# Altium schematic sheet logic_control.SchDoc
size 420 x 297 mm; SheetNumber: 4; SheetTotal: 5
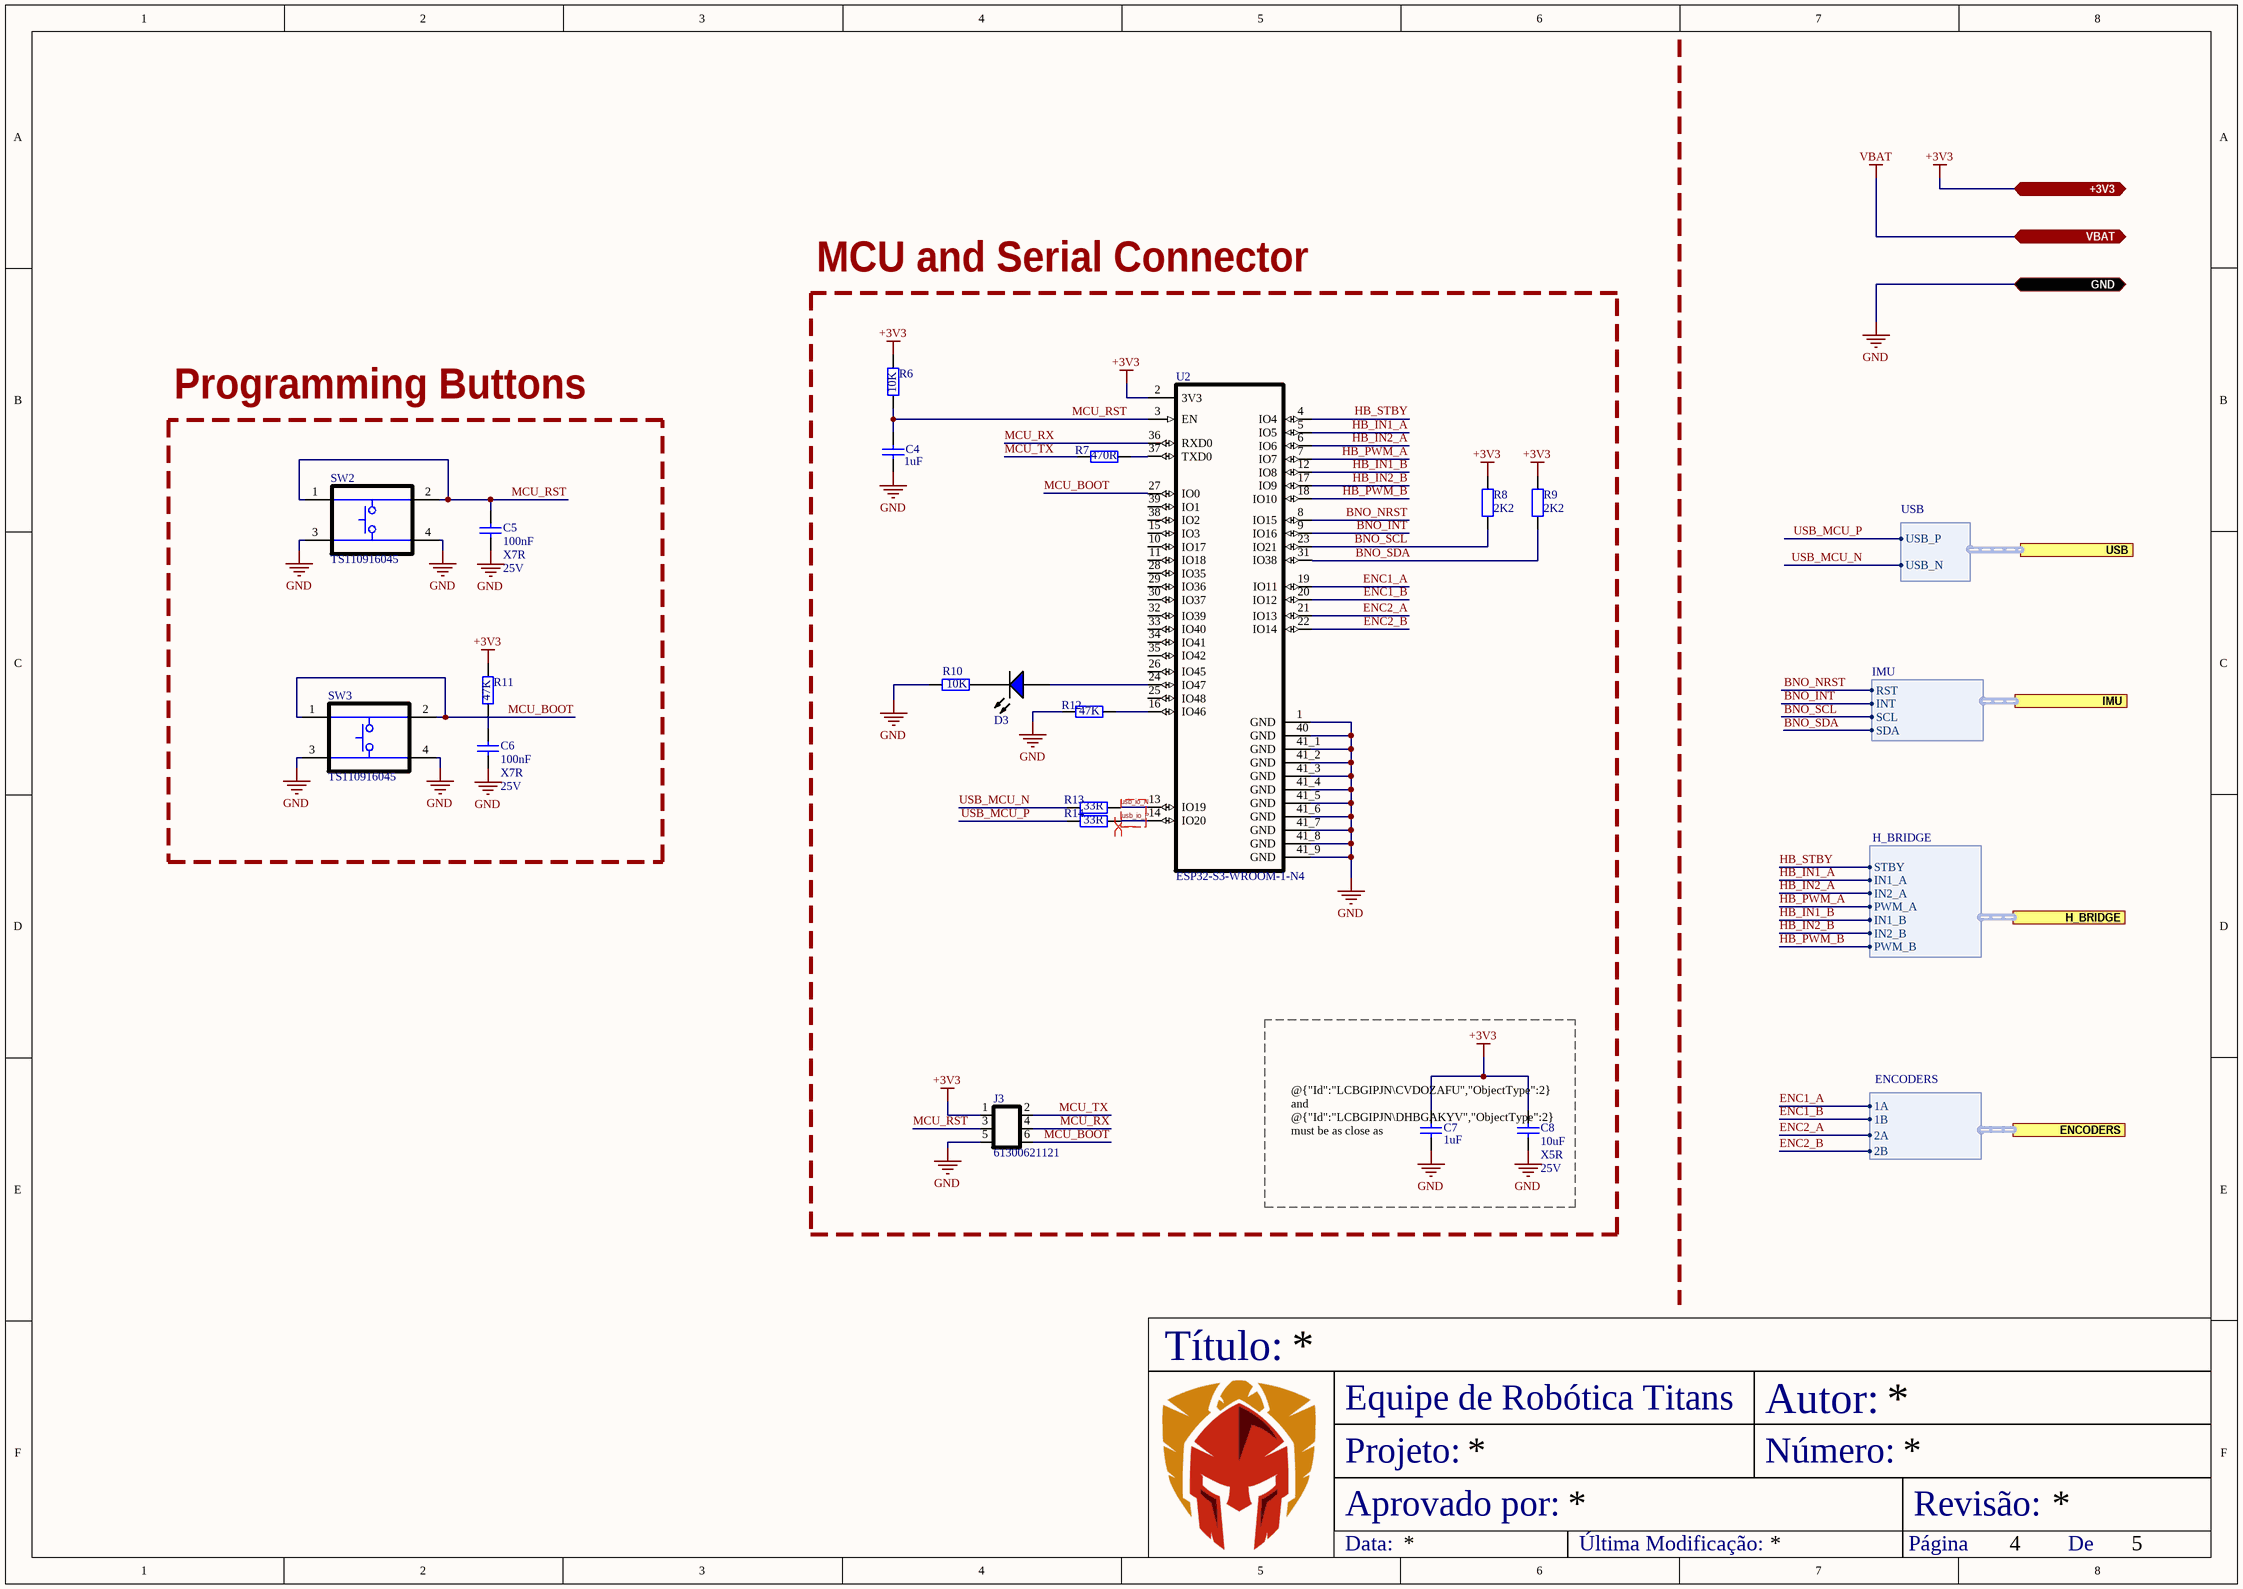
[diagram p0: logic_control.SchDoc]

## Parts
C4  value 1uF  [C0603_H0P8]  (hidden comment: CL10B105KO8NNNC)
C5  value 100nF  Temp Coef: X7R  Voltage: 25V  [C0402_H0P7]  (hidden comment: GRM155R71E104KE14J)
C6  value 100nF  Temp Coef: X7R  Voltage: 25V  [C0402_H0P7]  (hidden comment: GRM155R71E104KE14J)
C7  value 1uF  [C0603_H0P8]  (hidden comment: CL10B105KO8NNNC)
C8  value 10uF  Temp Coef: X5R  Voltage: 25V  [C0603_H0P8]  (hidden comment: GRM188R61E106MA73D)
D3  LTST-C171KBKT  [LTST-C171KXKT]  (value not drawn)
J3  61300621121  [61300621121]
R6  value 10K  [R0402_H0P4]  (hidden comment: RC0402FR-0710KL)
R7  470R  [R0402_H0P4]
R8  value 2K2  [R0402_H0P4]  (hidden comment: RC0402FR-072K2P)
R9  value 2K2  [R0402_H0P4]  (hidden comment: RC0402FR-072K2P)
R10  value 10K  [R0402_H0P4]  (hidden comment: RC0402FR-0710KL)
R11  value 47K  [R0402_H0P4]  (hidden comment: RC0402FR-7D47KL)
R12  value 47K  [R0402_H0P4]  (hidden comment: RC0402FR-7D47KL)
R13  value 33R  [R0402_H0P4]  (hidden comment: RC0402JR-0733RL)
R14  value 33R  [R0402_H0P4]  (hidden comment: RC0402JR-0733RL)
SW2  TS110916045  [TS110916045]
SW3  TS110916045  [TS110916045]
U2  ESP32-S3-WROOM-1-N4  [XCVR_ESP32-S3-WROOM-1-N4]

## Blocks framed on the sheet
MCU and Serial Connector: C4 C7 C8 D3 J3 R6-R10 R12-R14 U2
Programming Buttons: C5 C6 R11 SW2 SW3

## Ports
+3V3 (bidir, see block_diagram[4C], peripherials[8A], power_supply[8A]), ENCODERS (harness ENCODERS, see block_diagram[5C], peripherials[8E]), GND (bidir, see block_diagram[4D], peripherials[8B], power_supply[8B]), H_BRIDGE (harness H_BRIDGE, see block_diagram[5C], peripherials[8D]), IMU (harness IMU, see block_diagram[5C], peripherials[8C]), USB (harness USB, see block_diagram[4C], power_supply[8C]), VBAT (bidir, see block_diagram[4C], peripherials[8A], power_supply[8A])

## Harnesses
USB: USB_P, USB_N
H_BRIDGE: IN1_A, IN2_A, PWM_A, IN1_B, IN2_B, PWM_B, STBY
ENCODERS: 2A, 1B, 1A, 2B
IMU: RST, INT, SCL, SDA

## Nets
+3V3: C7.1 C8.1 J3.1 R6.2 R8.2 R9.2 R11.2 U2.2(3V3) ; port +3V3
GND: C4.2 C5.2 C6.2 C7.2 C8.2 J3.5 R10.2 R12.2 SW2.3 SW2.4 SW3.3 SW3.4 U2.1(GND) U2.40(GND) U2.41_1(GND) U2.41_2(GND) U2.41_3(GND) U2.41_4(GND) U2.41_5(GND) U2.41_6(GND) U2.41_7(GND) U2.41_8(GND) U2.41_9(GND) ; port GND
VBAT: port VBAT
BNO_INT: U2.9(IO16) ; port IMU.INT
BNO_NRST: U2.8(IO15) ; port IMU.RST
BNO_SCL: R8.1 U2.23(IO21) ; port IMU.SCL
BNO_SDA: R9.1 U2.31(IO38) ; port IMU.SDA
ENC1_A: U2.19(IO11) ; port ENCODERS.1A
ENC1_B: U2.20(IO12) ; port ENCODERS.1B
ENC2_A: U2.21(IO13) ; port ENCODERS.2A
ENC2_B: U2.22(IO14) ; port ENCODERS.2B
HB_IN1_A: U2.5(IO5) ; port H_BRIDGE.IN1_A
HB_IN1_B: U2.12(IO8) ; port H_BRIDGE.IN1_B
HB_IN2_A: U2.6(IO6) ; port H_BRIDGE.IN2_A
HB_IN2_B: U2.17(IO9) ; port H_BRIDGE.IN2_B
HB_PWM_A: U2.7(IO7) ; port H_BRIDGE.PWM_A
HB_PWM_B: U2.18(IO10) ; port H_BRIDGE.PWM_B
HB_STBY: U2.4(IO4) ; port H_BRIDGE.STBY
MCU_BOOT: C6.1 J3.6 R11.1 SW3.1 SW3.2 U2.27(IO0)
MCU_RST: C4.1 C5.1 J3.3 R6.1 SW2.1 SW2.2 U2.3(EN)
MCU_RX: J3.4 U2.36(RXD0)
MCU_TX: J3.2 R7.1
usb_io_N: R13.2 U2.13(IO19)
usb_io_P: R14.2 U2.14(IO20)
USB_MCU_N: R13.1 ; port USB.USB_N
USB_MCU_P: R14.1 ; port USB.USB_P
NetD3_1: D3.1(A) R10.1
NetD3_2: D3.2(K) U2.24(IO47)
NetR7_2: R7.2 U2.37(TXD0)
NetR12_1: R12.1 U2.16(IO46)

Not connected (* = marked no-connect by the designer): U2 10(IO17) 11(IO18) 15(IO3) 25(IO48) 26(IO45) 28(IO35) 29(IO36) 30(IO37) 32(IO39) 33(IO40) 34(IO41) 35(IO42) 38(IO2) 39(IO1)

## Layout directives
differential pair: usb_io_N, usb_io_P

## Notes on the sheet
- (near C7) @{"Id":"LCBGIPJN\CVDOZAFU","ObjectType":2} and @{"Id":"LCBGIPJN\DHBGAKYV","ObjectType":2} must be as close as possible to @{"Id":"DQXPMPHC\KIOCFBXS","ObjectType":1} on @{"Id":"LCBGIPJN\XXUJFBYU","ObjectType":2} pin 2.
- Título:
- Equipe de Robótica Titans
- Projeto:
- Autor:
- Número:
- Aprovado por:
- Revisão:
- Data:
- Última Modificação:
- Página
- De

## Library data of the parts
C4 C7 = C1uF 16V 0603: 1uF 16V X7R 10%; Manufacturer: Samsung; Dielectric Material: Ceramic; Multilayer: Yes; Supplier: Avnet; Supplier Part Number: CL10B105KO8NNNC; Manufacturer Part Number: CL10B105KO8NNNC; RoHS: Yes; Category: Ceramic Capacitors; Stock: 3952000; Pricing: 4000=0.00408, 8000=0.00401, 16000=0.00394, 24000=0.00388, 32000=0.00381 (USD); Mounting Technology: Surface Mount; Pins: 2; Package Shape: Rectangular; Case/Package: 0603; Terminal Finish: Nickel; Min Operating Temperature: -55°C; Max Operating Temperature: 125°C; JESD-609 Code: e3; Termination: Wraparound; Capacitor Type: Ceramic; Tolerance  (fill in as +-): 10%; Packaging: Tape and Reel; Tolerance (fill in as +-): 10%; Rated DC Voltage (URdc): 16V; Temperature Characteristics Code: X7R; Reach SVHC Compliant: Yes; RoHS Compliant: Yes; ComponentLink1URL: https://datasheet.ciiva.com:443/pdfs/VipMasterIC/IC/SEMS/SEMS-S-A0008529196/SEMS-S-A0008529196-1.pdf?src-supplier=IHS+Markit; ComponentLink1Description: https://datasheet.ciiva.com:443/pdfs/VipMasterIC/IC/SEMS/SEMS-S-A0008529196/SEMS-S-A0008529196-1.pdf?src-supplier=IHS+Markit; ComponentLink2URL: https://datasheet.ciiva.com/15195/getdatasheetpartid-357418-15195728.pdf?src-supplier=Verical; ComponentLink2Description: https://datasheet.ciiva.com/15195/getdatasheetpartid-357418-15195728.pdf?src-supplier=Verical; ComponentLink3URL: https://datasheet.ciiva.com/29198/458176-da-01-en-vs-kondensator-0603-29198478.pdf?src-supplier=Conrad; ComponentLink3Description: https://datasheet.ciiva.com/29198/458176-da-01-en-vs-kondensator-0603-29198478.pdf?src-supplier=Conrad
C5 C6 = C100nF 25V 0402: 100nF 25V X7R 10% 0402; Manufacturer: Murata Electronics; Type: Capacitor; Package: 0402 (1005 Metric); Manufacturer Part Number: GRM155R71E104KE14J; Supplier 1: Digikey; Supplier Part Number 1: 490-14603-1-ND; Supplier Link 1: https://www.digikey.fr/product-detail/en/murata-electronics/GRM155R71E104KE14J/490-14603-1-ND/6606209; Datasheet: https://search.murata.co.jp/Ceramy/image/img/A01X/G101/ENG/GRM155R71E104KE14-01.pdf; Tolerance: 10%; RoHS Compliant: Yes
C8 = C10uF 25V 0603: 10uF 25V X5R 20% 0603; Manufacturer: Murata Electronics North America; Internal Code: 0-ECCAP10uX5RV25%20P0603-; Type: Capacitor; Package: 0603; Manufacturer Part Number: GRM188R61E106MA73D; Supplier 1: DigiKey; Supplier Part Number 1: 490-7202-1-ND; Supplier Link 1: https://www.digikey.com/products/en?keywords=490-7202-1-ND; Datasheet: https://www.murata.com/~/media/webrenewal/support/library/catalog/products/capacitor/mlcc/c02e.ashx?la=en-us; Tolerance: 20%; Packaging: Cut Tape; RoHS Compliant: Yes
D3 = LTST-C171KBKT: LED BLUE 0805 wavelength 470nm light intensity 35mcd Front Mounting; Manufacturer: Lite-On; Color: RED; Dominant Wavelength: 468nm; Forward Current: 30mA; Forward Voltage: 2V; Lens Color: Clear, Colorless; Lens Style: Clear; Number of Circuits: 1; Power Dissipation: 75mW; Reverse Voltage: 5V; Shape: Rectangular; Test Current: 20mA; Viewing Angle: 130°; Wavelength: 570nm; Supplier: DigiKey; Supplier Part Number: 160-1645-1-ND; Manufacturer Part Number: LTST-C171KBKT; RoHS: Compliant; Category: LEDs; Stock: 263738; Pricing: 1=0.11, 10=0.077, 100=0.0529, 500=0.04166, 1000=0.03789 (USD); Case/Package: 0805; Case Code (Imperial): 0805; Case Code (Metric): 2012; China RoHS: Compliant; Depth: 1.25mm; Height: 800µm; Illumination Color: BLUE; Lead Free: Lead Free; Length: 2mm; Lens Transparency: Clear; Lifecycle Status: Production; Luminous Intensity: 35mcd; Max Operating Temperature: 85°C; Min Operating Temperature: -55°C; Mounting Technology: Surface Mount; Number of Elements: 1; Number of LEDs: 1; Pins: 2; Number of Terminals: 2; Peak Wavelength: 468nm; Power Rating: 75mW; Radiation Hardening: No; REACH SVHC: Yes; Schedule B: 8541402000, 8541402000|8541402000|8541402000|8541402000|8541402000; Terminal Pitch: 2.5mm; Width: 1.25mm; ComponentLink1URL: https://datasheet.octopart.com:443/LTST-C171KGKT-Lite-On-datasheet-62340967.pdf?src-supplier=ODG+(Origin+Data+Global); ComponentLink1Description: https://datasheet.octopart.com:443/LTST-C171KGKT-Lite-On-datasheet-62340967.pdf?src-supplier=ODG+(Origin+Data+Global); ComponentLink2URL: https://datasheet.octopart.com:443/LTST-C171KGKT-Lite-On-datasheet-180605161.pdf?src-supplier=IHS; ComponentLink2Description: https://datasheet.octopart.com:443/LTST-C171KGKT-Lite-On-datasheet-180605161.pdf?src-supplier=IHS; ComponentLink3URL: https://datasheet.octopart.com:443/LTST-C171KGKT-Lite-On-datasheet-159335.pdf?src-supplier=_legacy+Avnet; ComponentLink3Description: https://datasheet.octopart.com:443/LTST-C171KGKT-Lite-On-datasheet-159335.pdf?src-supplier=_legacy+Avnet; ComponentLink4URL: https://datasheet.octopart.com:443/LTST-C171KGKT-Lite-On-datasheet-166322636.pdf?src-supplier=TME; ComponentLink4Description: https://datasheet.octopart.com:443/LTST-C171KGKT-Lite-On-datasheet-166322636.pdf?src-supplier=TME; ComponentLink5URL: https://datasheet.octopart.com:443/LTST-C171KGKT-Lite-On-datasheet-165573808.pdf?src-supplier=TME; ComponentLink5Description: https://datasheet.octopart.com:443/LTST-C171KGKT-Lite-On-datasheet-165573808.pdf?src-supplier=TME; ComponentLink6URL: https://datasheet.octopart.com:443/LTST-C171KGKT-Lite-On-datasheet-137080783.pdf?src-supplier=X-ON; ComponentLink6Description: https://datasheet.octopart.com:443/LTST-C171KGKT-Lite-On-datasheet-137080783.pdf?src-supplier=X-ON; ComponentLink7URL: https://datasheet.octopart.com:443/LTST-C171KGKT-Lite-On-datasheet-8328465.pdf?src-supplier=Future+Electronics; ComponentLink7Description: https://datasheet.octopart.com:443/LTST-C171KGKT-Lite-On-datasheet-8328465.pdf?src-supplier=Future+Electronics; ComponentLink8URL: https://datasheet.octopart.com:443/LTST-C171KGKT-Lite-On-datasheet-19967.pdf?src-supplier=DigiKey; ComponentLink8Description: https://datasheet.octopart.com:443/LTST-C171KGKT-Lite-On-datasheet-19967.pdf?src-supplier=DigiKey; ComponentLink9URL: https://datasheet.octopart.com:443/LTST-C171KGKT-Lite-On-datasheet-14175002.pdf?src-supplier=iiiC; ComponentLink9Description: https://datasheet.octopart.com:443/LTST-C171KGKT-Lite-On-datasheet-14175002.pdf?src-supplier=iiiC; Supplier 1: DigiKey; Supplier Part Number 1: 160-1426-1-ND; Supplier 2: DigiKey; Supplier Part Number 2: 160-1426-2-ND; Supplier 3: Mouser; Supplier Part Number 3: 859-LTST-C171KGKT
J3 = CON HEADER 2X3P: Header, 2.54Mm, Pin, Tht, Vertical, 6Way; |Würth Elektronik 61300621121; Manufacturer: Wurth Elektronik; Manufacturer Lifecycle Status: ACTIVE; MF: {'manufacturer': u'Wurth Elektronik'}; Connector Type: Male Pin; Contact Resistance: 20mΩ; Current Rating: 3A; Gender: Male; Insulation Resistance: 1GΩ; Number of Contacts: 6; Operating Supply Voltage: 250V; YEOL: 1 = Estimated lifetime > 10 years; Package: None; Price: None; Value: *; MP: 61300621121; Availability: Unavailable; Supplier: Newark; Supplier Part Number: 61300621121; Manufacturer Part Number: 61300621121; RoHS: Compliant; Category: Headers and Wire Housings; Stock: 16511; Pricing: 1=0,641, 10=0,56, 25=0,533, 50=0,498, 100=0,478, 500=0,45, 1000=0,418, 5000=0,385 (USD); Color: Black; Contact Material: Gold; Contact Mating Length: 5.9944mm; Contact Plating: Gold; Height: 8.89mm; Lead Pitch: 2.54mm; Length: 7.62mm; Lifecycle Status: Production; Max Operating Temperature: 105°C; Min Operating Temperature: -40°C; Mounting Technology: Through Hole; Pins: 6; Number of Positions: 6; Number of Rows: 2; Orientation: Vertical; Packaging: Bulk; Pitch: 2.54mm; Row Spacing: 2.54mm; Termination: Solder; Voltage Rating: 250V; ComponentLink1URL: https://datasheet.octopart.com:443/61300621121-W%C3%BCrth-Elektronik-datasheet-149524079.pdf?src-supplier=Wurth+Elektronik; ComponentLink1Description: https://datasheet.octopart.com:443/61300621121-W%C3%BCrth-Elektronik-datasheet-149524079.pdf?src-supplier=Wurth+Elektronik; ComponentLink2URL: https://datasheet.octopart.com:443/61300621121-W%C3%BCrth-Elektronik-datasheet-45185731.pdf?src-supplier=HQonline; ComponentLink2Description: https://datasheet.octopart.com:443/61300621121-W%C3%BCrth-Elektronik-datasheet-45185731.pdf?src-supplier=HQonline; ComponentLink3URL: https://datasheet.octopart.com:443/61300621121-W%C3%BCrth-Elektronik-datasheet-10693404.pdf?src-supplier=Newark; ComponentLink3Description: https://datasheet.octopart.com:443/61300621121-W%C3%BCrth-Elektronik-datasheet-10693404.pdf?src-supplier=Newark
R6 R10 = R10K 1% 0402: 10K 1% 0402 1/16W; Manufacturer: Yageo; Internal Code: 0-ECRES10K%01P0402-YG; Tolerance: 1%; Package: 0402; Manufacturer Part Number: RC0402FR-0710KL; Supplier 1: DigiKey; Supplier Part Number 1: 311-10.0KLRCT-ND; Supplier Link 1: https://www.digikey.com/product-detail/en/yageo/RC0402FR-0710KL/311-10.0KLRCT-ND/729470; Datasheet: http://www.yageo.com/documents/recent/PYu-RC_Group_51_RoHS_L_10.pdf; Type: Resistor; Power: 1/16W
R7 = R470 1% 0402: 470R 1% 0402 1/16W; Manufacturer: Yageo; Manufacturer Part Number: RC0402FR-07470RL; Additional Feature: LASER TRIMMABLE; Power: 62.5mW; Rated Temperature: 70°C; Working Voltage: 50V; Temperature Coefficient (ppm/Cel): 100; Package Height: 0.35mm; Package Length: 1mm; Package Width: 0.5mm; Supplier: Digikey; Supplier Part Number: 311-470LRCT-ND; RoHS: Yes; Category: Chip SMD Resistors; Stock: 1075453; Pricing: 1=0.1, 10=0.008, 25=0.004, 50=0.003 (USD); Mounting Technology: Surface Mount; Pins: 2; Package Shape: Rectangular; Case/Package: 0402; Terminal Finish: Nickel; Min Operating Temperature: -55°C; Max Operating Temperature: 155°C; Tolerance: 1%; JESD-609 Code: e3; Resistor Type: FIXED RESISTOR; Construction: Chip; Packaging: Tape and Reel; Technology: METAL GLAZE/THICK FILM; Termination: Wraparound; Reach SVHC Compliant: Yes; RoHS Compliant: Yes; ComponentLink1URL: https://datasheet.ciiva.com:443/pdfs/VipMasterIC/IC/YAGO/YAGO-S-A0008145938/YAGO-S-A0008145938-1.pdf?src-supplier=IHS+Markit; ComponentLink1Description: https://datasheet.ciiva.com:443/pdfs/VipMasterIC/IC/YAGO/YAGO-S-A0008145938/YAGO-S-A0008145938-1.pdf?src-supplier=IHS+Markit; ComponentLink2URL: https://datasheet.ciiva.com/2453/pyu-r-int-thick-7-2453376.pdf?src-supplier=Digikey; ComponentLink2Description: https://datasheet.ciiva.com/2453/pyu-r-int-thick-7-2453376.pdf?src-supplier=Digikey; ComponentLink3URL: https://datasheet.ciiva.com/2453/pyu-r-int-thick-7-2453377.pdf?src-supplier=Digikey; ComponentLink3Description: https://datasheet.ciiva.com/2453/pyu-r-int-thick-7-2453377.pdf?src-supplier=Digikey; ComponentLink4URL: https://datasheet.ciiva.com/2453/pyu-r-int-thick-7-2453378.pdf?src-supplier=Digikey; ComponentLink4Description: https://datasheet.ciiva.com/2453/pyu-r-int-thick-7-2453378.pdf?src-supplier=Digikey; ComponentLink5URL: https://datasheet.ciiva.com/15189/getdatasheetpartid-330246-15189463.pdf?src-supplier=Verical; ComponentLink5Description: https://datasheet.ciiva.com/15189/getdatasheetpartid-330246-15189463.pdf?src-supplier=Verical; ComponentLink6URL: https://datasheet.ciiva.com/7850/1018594-7850014.pdf?src-supplier=Element14; ComponentLink6Description: https://datasheet.ciiva.com/7850/1018594-7850014.pdf?src-supplier=Element14; ComponentLink7URL: https://datasheet.ciiva.com/7850/1018594-7850015.pdf?src-supplier=Element14; ComponentLink7Description: https://datasheet.ciiva.com/7850/1018594-7850015.pdf?src-supplier=Element14; ComponentLink8URL: https://datasheet.ciiva.com/46412/1018594-46412838.pdf?src-supplier=Element14; ComponentLink8Description: https://datasheet.ciiva.com/46412/1018594-46412838.pdf?src-supplier=Element14; Value: 470R
R8 R9 = R2K2 1% 0402: 2K2 1% 0402 1/16W; Manufacturer: Yageo; Tolerance: 1%; Package: 0402; Manufacturer Part Number: RC0402FR-072K2P; Supplier 1: DigiKey; Supplier Part Number 1: YAG1260CT-ND; Supplier Link 1: https://www.digikey.fr/product-detail/en/yageo/RC0402FR-072K2P/YAG1260CT-ND/4935375; Datasheet: https://www.yageo.com/upload/media/product/productsearch/datasheet/rchip/PYu-RC_51_RoHS_P_1.pdf; Type: Resistor; Power: 1/16W
R11 R12 = R47K 1% 0402: 47K 1% 0402 1/16W; Manufacturer: Yageo; Tolerance: 1%; Package: 0402; Manufacturer Part Number: RC0402FR-7D47KL; Type: Resistor; Power: 1/16W; Supplier 1: Mouser; Supplier Part Number 1: 603-RC0402FR-7D47KL
R13 R14 = R33 1% 0402: Res Thick Film 0402 33 Ohm 5% 0.063W(1/16W) ±100ppm/C Pad SMD T/R; Manufacturer: Yageo Group; Max Power Dissipation: 63mW; Power Rating: 62.5mW; Temperature Coefficient: 100ppm/°C; Voltage Rating: 50V; Supplier: DigiKey; Supplier Part Number: 311-33JRDKR-ND; Manufacturer Part Number: RC0402JR-0733RL; RoHS: Compliant; Category: Chip SMD Resistors; Stock: 4800627; Pricing: 1=0,1, 10=0,019, 25=0,0136, 50=0,0108, 100=0,0087, 250=0,0066, 500=0,00542, 1000=0,00451, 5000=0,00309 (USD); Case/Package: 0402; Case Code (Imperial): 0402; China RoHS: Non-Compliant; Composition: Thick Film; Country of Origin: Mainland China, Taiwan; Depth: 500µm; Export Control Classification Number (ECCN) Code: EAR99; Features: Moisture Resistant; Height: 350µm; Harmonized Tariff Schedule (HTS) Code: 8533.21.00.30; Introduction Date: 2008-07-18; Lead Free: Lead Free; Length: 1mm; Lifecycle Status: Production; Max Operating Temperature: 155°C; Military Standard: Not; Min Operating Temperature: -55°C; Mounting Technology: Surface Mount; Pins: 2; Number of Terminals: 2; Number of Terminations: 2; Packaging: Cut Tape; REACH SVHC: Yes; Schedule B: 8533210045, 8533210045|8533210045, 8533210045|8533210045|8533210045, 8533210045|8533210045|8533210045|8533210045; Termination: SMD/SMT; Voltage Rating (AC): 50V; Voltage Rating (DC): 50V; Width: 500µm; Working Voltage: 50V; ComponentLink1URL: https://datasheet.octopart.com:443/RC0402JR-0733RL-Yageo-datasheet-175887523.pdf?src-supplier=Newark; ComponentLink1Description: https://datasheet.octopart.com:443/RC0402JR-0733RL-Yageo-datasheet-175887523.pdf?src-supplier=Newark; ComponentLink2URL: https://datasheet.octopart.com:443/RC0402JR-0733RL-Yageo-datasheet-10408619.pdf?src-supplier=Newark; ComponentLink2Description: https://datasheet.octopart.com:443/RC0402JR-0733RL-Yageo-datasheet-10408619.pdf?src-supplier=Newark; ComponentLink3URL: https://datasheet.octopart.com:443/RC0402JR-0733RL-Yageo-datasheet-8324527.pdf?src-supplier=Newark; ComponentLink3Description: https://datasheet.octopart.com:443/RC0402JR-0733RL-Yageo-datasheet-8324527.pdf?src-supplier=Newark; ComponentLink4URL: https://datasheet.octopart.com:443/RC0402JR-0733RL-Yageo-datasheet-141265859.pdf?src-supplier=Upverter; ComponentLink4Description: https://datasheet.octopart.com:443/RC0402JR-0733RL-Yageo-datasheet-141265859.pdf?src-supplier=Upverter; ComponentLink5URL: https://sigma.octopart.com:443/138820526/technical_drawing/Yageo-RC0402JR-0733RL.pdf?src-supplier=Upverter; ComponentLink5Description: https://sigma.octopart.com:443/138820526/technical_drawing/Yageo-RC0402JR-0733RL.pdf?src-supplier=Upverter; ComponentLink6URL: https://datasheet.octopart.com:443/RC0402JR-0733RL-Yageo-datasheet-62067350.pdf?src-supplier=element14+APAC; ComponentLink6Description: https://datasheet.octopart.com:443/RC0402JR-0733RL-Yageo-datasheet-62067350.pdf?src-supplier=element14+APAC; ComponentLink7URL: https://datasheet.octopart.com:443/RC0402JR-0733RL-Yageo-Group-datasheet-176638170.pdf?src-supplier=Future+Electronics; ComponentLink7Description: https://datasheet.octopart.com:443/RC0402JR-0733RL-Yageo-Group-datasheet-176638170.pdf?src-supplier=Future+Electronics; ComponentLink8URL: https://datasheet.octopart.com:443/RC0402JR-0733RL-Yageo-datasheet-164759695.pdf?src-supplier=Future+Electronics; ComponentLink8Description: https://datasheet.octopart.com:443/RC0402JR-0733RL-Yageo-datasheet-164759695.pdf?src-supplier=Future+Electronics; ComponentLink9URL: https://datasheet.octopart.com:443/RC0402JR-0733RL-Yageo-datasheet-127823281.pdf?src-supplier=Future+Electronics; ComponentLink9Description: https://datasheet.octopart.com:443/RC0402JR-0733RL-Yageo-datasheet-127823281.pdf?src-supplier=Future+Electronics; ComponentLink10URL: https://datasheet.octopart.com:443/RC0402JR-0733RL-Yageo-datasheet-137700087.pdf?src-supplier=Future+Electronics; ComponentLink10Description: https://datasheet.octopart.com:443/RC0402JR-0733RL-Yageo-datasheet-137700087.pdf?src-supplier=Future+Electronics; ComponentLink11URL: https://datasheet.octopart.com:443/RC0402JR-0733RL-Yageo-datasheet-103092701.pdf?src-supplier=Future+Electronics; ComponentLink11Description: https://datasheet.octopart.com:443/RC0402JR-0733RL-Yageo-datasheet-103092701.pdf?src-supplier=Future+Electronics; ComponentLink12URL: https://datasheet.octopart.com:443/RC0402JR-0733RL-Yageo-datasheet-98239111.pdf?src-supplier=Future+Electronics; ComponentLink12Description: https://datasheet.octopart.com:443/RC0402JR-0733RL-Yageo-datasheet-98239111.pdf?src-supplier=Future+Electronics; ComponentLink13URL: https://datasheet.octopart.com:443/RC0402JR-0733RL-Yageo-datasheet-77992522.pdf?src-supplier=Future+Electronics; ComponentLink13Description: https://datasheet.octopart.com:443/RC0402JR-0733RL-Yageo-datasheet-77992522.pdf?src-supplier=Future+Electronics; ComponentLink14URL: https://datasheet.octopart.com:443/RC0402JR-0733RL-Yageo-datasheet-67302840.pdf?src-supplier=Future+Electronics; ComponentLink14Description: https://datasheet.octopart.com:443/RC0402JR-0733RL-Yageo-datasheet-67302840.pdf?src-supplier=Future+Electronics; ComponentLink15URL: https://datasheet.octopart.com:443/RC0402JR-0733RL-Yageo-datasheet-12531192.pdf?src-supplier=Future+Electronics; ComponentLink15Description: https://datasheet.octopart.com:443/RC0402JR-0733RL-Yageo-datasheet-12531192.pdf?src-supplier=Future+Electronics; ComponentLink16URL: https://datasheet.octopart.com:443/RC0402JR-0733RL-Yageo-datasheet-505231.pdf?src-supplier=Future+Electronics; ComponentLink16Description: https://datasheet.octopart.com:443/RC0402JR-0733RL-Yageo-datasheet-505231.pdf?src-supplier=Future+Electronics; ComponentLink17URL: https://datasheet.octopart.com/RC0402JR-0733RL-Yageo-datasheet-73766026.pdf; ComponentLink17Description: https://datasheet.octopart.com/RC0402JR-0733RL-Yageo-datasheet-73766026.pdf; ComponentLink18URL: https://datasheet.octopart.com:443/RC0402JR-0733RL-Yageo-datasheet-8329306.pdf?src-supplier=element14; ComponentLink18Description: https://datasheet.octopart.com:443/RC0402JR-0733RL-Yageo-datasheet-8329306.pdf?src-supplier=element14; ComponentLink19URL: http://sigma.octopart.com:80/conflict_mineral_statement/Yageo-company-3.pdf?src-supplier=Compliance+Statements; ComponentLink19Description: http://sigma.octopart.com:80/conflict_mineral_statement/Yageo-company-3.pdf?src-supplier=Compliance+Statements; ComponentLink20URL: http://sigma.octopart.com:80/rohs_statement/Yageo-company-2.pdf?src-supplier=Compliance+Statements; ComponentLink20Description: http://sigma.octopart.com:80/rohs_statement/Yageo-company-2.pdf?src-supplier=Compliance+Statements; Supplier 1: DigiKey; Supplier Part Number 1: 311-33JRDKR-ND; Supplier 2: DigiKey; Supplier Part Number 2: 311-33JRCT-ND; Tolerance: 5%
SW2 SW3 = TS110916045: Tactile Switch SPST 1.6N 4.5mm; Manufacturer 1: HanElectricity; Manufacturer Part Number 1: C22375350; Supplier 1: LCSC; Supplier Part Number 1: C22375350; Supplier Unit Price 1: 0.0056; Supplier Link 1: https://www.lcsc.com/product-detail/C22375350.html?spm=wm.fly.bg.5.xh&lcsc_vid=FlhaAlQAEVMNVwEHT1BfXwFWEwcLXgcEEldWBVUDFFcxVlNRQlBYUFNUR1VWUjsOAxUeFF5JWBYZEEoBGA4JCwFIFA4DSA%3D%3D
U2 = ESP32-S3-WROOM-1-N4: MF: {'manufacturer': u'Espressif Systems'}; Package: None; Price: None; Value: *; MP: ESP32-S3-WROOM-1-N4; Availability: Unavailable